# Altium schematic sheet pc_data_bus_input_switches.SchDoc
size A3; SheetNumber: 10; SheetTotal: 18
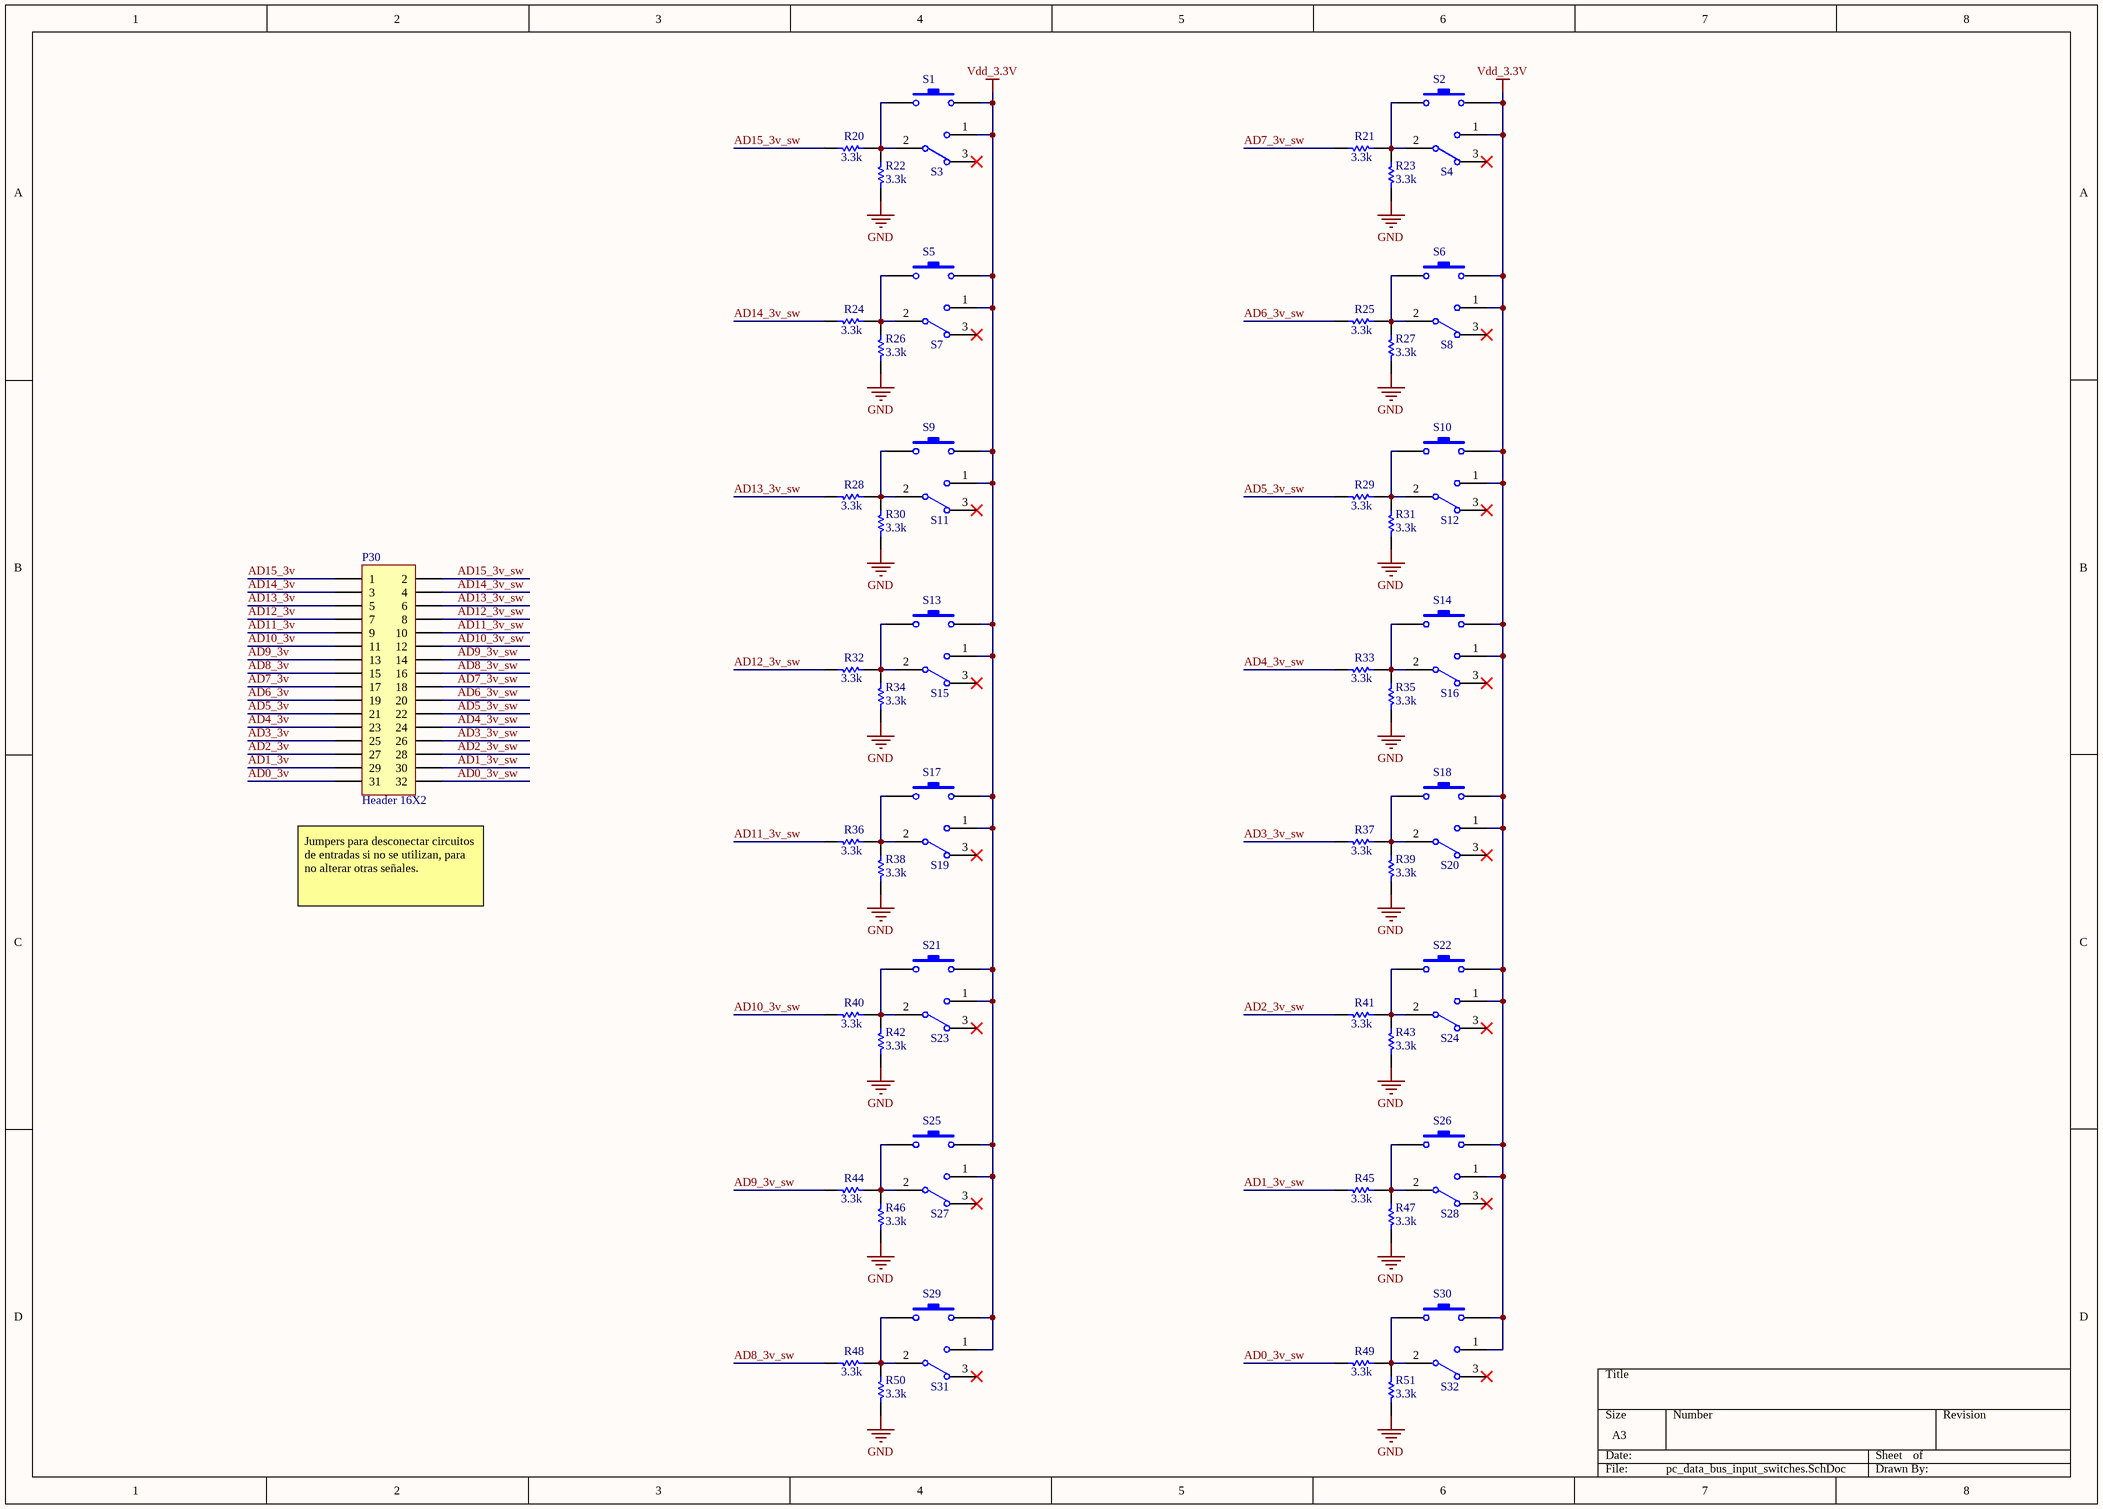
[diagram p0: pc_data_bus_input_switches.SchDoc]

## Parts
P30  Header 16X2  [HDR2X16]
R20  value 3.3k  [resistor 0603]  (hidden comment: resistor)
R21  value 3.3k  [resistor 0603]  (hidden comment: resistor)
R22  value 3.3k  [resistor 0603]  (hidden comment: resistor)
R23  value 3.3k  [resistor 0603]  (hidden comment: resistor)
R24  value 3.3k  [resistor 0603]  (hidden comment: resistor)
R25  value 3.3k  [resistor 0603]  (hidden comment: resistor)
R26  value 3.3k  [resistor 0603]  (hidden comment: resistor)
R27  value 3.3k  [resistor 0603]  (hidden comment: resistor)
R28  value 3.3k  [resistor 0603]  (hidden comment: resistor)
R29  value 3.3k  [resistor 0603]  (hidden comment: resistor)
R30  value 3.3k  [resistor 0603]  (hidden comment: resistor)
R31  value 3.3k  [resistor 0603]  (hidden comment: resistor)
R32  value 3.3k  [resistor 0603]  (hidden comment: resistor)
R33  value 3.3k  [resistor 0603]  (hidden comment: resistor)
R34  value 3.3k  [resistor 0603]  (hidden comment: resistor)
R35  value 3.3k  [resistor 0603]  (hidden comment: resistor)
R36  value 3.3k  [resistor 0603]  (hidden comment: resistor)
R37  value 3.3k  [resistor 0603]  (hidden comment: resistor)
R38  value 3.3k  [resistor 0603]  (hidden comment: resistor)
R39  value 3.3k  [resistor 0603]  (hidden comment: resistor)
R40  value 3.3k  [resistor 0603]  (hidden comment: resistor)
R41  value 3.3k  [resistor 0603]  (hidden comment: resistor)
R42  value 3.3k  [resistor 0603]  (hidden comment: resistor)
R43  value 3.3k  [resistor 0603]  (hidden comment: resistor)
R44  value 3.3k  [resistor 0603]  (hidden comment: resistor)
R45  value 3.3k  [resistor 0603]  (hidden comment: resistor)
R46  value 3.3k  [resistor 0603]  (hidden comment: resistor)
R47  value 3.3k  [resistor 0603]  (hidden comment: resistor)
R48  value 3.3k  [resistor 0603]  (hidden comment: resistor)
R49  value 3.3k  [resistor 0603]  (hidden comment: resistor)
R50  value 3.3k  [resistor 0603]  (hidden comment: resistor)
R51  value 3.3k  [resistor 0603]  (hidden comment: resistor)
S1  Button  [Tact switch]  (value not drawn)
S2  Button  [Tact switch]  (value not drawn)
S3  SW-SPDT  [Slide switch 2mm pitch]  (value not drawn)
S4  SW-SPDT  [Slide switch 2mm pitch]  (value not drawn)
S5  Button  [Tact switch]  (value not drawn)
S6  Button  [Tact switch]  (value not drawn)
S7  SW-SPDT  [Slide switch 2mm pitch]  (value not drawn)
S8  SW-SPDT  [Slide switch 2mm pitch]  (value not drawn)
S9  Button  [Tact switch]  (value not drawn)
S10  Button  [Tact switch]  (value not drawn)
S11  SW-SPDT  [Slide switch 2mm pitch]  (value not drawn)
S12  SW-SPDT  [Slide switch 2mm pitch]  (value not drawn)
S13  Button  [Tact switch]  (value not drawn)
S14  Button  [Tact switch]  (value not drawn)
S15  SW-SPDT  [Slide switch 2mm pitch]  (value not drawn)
S16  SW-SPDT  [Slide switch 2mm pitch]  (value not drawn)
S17  Button  [Tact switch]  (value not drawn)
S18  Button  [Tact switch]  (value not drawn)
S19  SW-SPDT  [Slide switch 2mm pitch]  (value not drawn)
S20  SW-SPDT  [Slide switch 2mm pitch]  (value not drawn)
S21  Button  [Tact switch]  (value not drawn)
S22  Button  [Tact switch]  (value not drawn)
S23  SW-SPDT  [Slide switch 2mm pitch]  (value not drawn)
S24  SW-SPDT  [Slide switch 2mm pitch]  (value not drawn)
S25  Button  [Tact switch]  (value not drawn)
S26  Button  [Tact switch]  (value not drawn)
S27  SW-SPDT  [Slide switch 2mm pitch]  (value not drawn)
S28  SW-SPDT  [Slide switch 2mm pitch]  (value not drawn)
S29  Button  [Tact switch]  (value not drawn)
S30  Button  [Tact switch]  (value not drawn)
S31  SW-SPDT  [Slide switch 2mm pitch]  (value not drawn)
S32  SW-SPDT  [Slide switch 2mm pitch]  (value not drawn)

## Nets
GND: R22.2 R23.2 R26.2 R27.2 R30.2 R31.2 R34.2 R35.2 R38.2 R39.2 R42.2 R43.2 R46.2 R47.2 R50.2 R51.2
Vdd_3.3V: S1.2 S2.2 S3.1 S4.1 S5.2 S6.2 S7.1 S8.1 S9.2 S10.2 S11.1 S12.1 S13.2 S14.2 S15.1 S16.1 S17.2 S18.2 S19.1 S20.1 S21.2 S22.2 S23.1 S24.1 S25.2 S26.2 S27.1 S28.1 S29.2 S30.2 S31.1 S32.1
AD0_3v: P30.31
AD0_3v_sw: P30.32 R49.1
AD1_3v: P30.29
AD1_3v_sw: P30.30 R45.1
AD2_3v: P30.27
AD2_3v_sw: P30.28 R41.1
AD3_3v: P30.25
AD3_3v_sw: P30.26 R37.1
AD4_3v: P30.23
AD4_3v_sw: P30.24 R33.1
AD5_3v: P30.21
AD5_3v_sw: P30.22 R29.1
AD6_3v: P30.19
AD6_3v_sw: P30.20 R25.1
AD7_3v: P30.17
AD7_3v_sw: P30.18 R21.1
AD8_3v: P30.15
AD8_3v_sw: P30.16 R48.1
AD9_3v: P30.13
AD9_3v_sw: P30.14 R44.1
AD10_3v: P30.11
AD10_3v_sw: P30.12 R40.1
AD11_3v: P30.9
AD11_3v_sw: P30.10 R36.1
AD12_3v: P30.7
AD12_3v_sw: P30.8 R32.1
AD13_3v: P30.5
AD13_3v_sw: P30.6 R28.1
AD14_3v: P30.3
AD14_3v_sw: P30.4 R24.1
AD15_3v: P30.1
AD15_3v_sw: P30.2 R20.1
NetR20_2: R20.2 R22.1 S1.1 S3.2
NetR21_2: R21.2 R23.1 S2.1 S4.2
NetR24_2: R24.2 R26.1 S5.1 S7.2
NetR25_2: R25.2 R27.1 S6.1 S8.2
NetR28_2: R28.2 R30.1 S9.1 S11.2
NetR29_2: R29.2 R31.1 S10.1 S12.2
NetR32_2: R32.2 R34.1 S13.1 S15.2
NetR33_2: R33.2 R35.1 S14.1 S16.2
NetR36_2: R36.2 R38.1 S17.1 S19.2
NetR37_2: R37.2 R39.1 S18.1 S20.2
NetR40_2: R40.2 R42.1 S21.1 S23.2
NetR41_2: R41.2 R43.1 S22.1 S24.2
NetR44_2: R44.2 R46.1 S25.1 S27.2
NetR45_2: R45.2 R47.1 S26.1 S28.2
NetR48_2: R48.2 R50.1 S29.1 S31.2
NetR49_2: R49.2 R51.1 S30.1 S32.2

Not connected (* = marked no-connect by the designer): S3 3*; S4 3*; S7 3*; S8 3*; S11 3*; S12 3*; S15 3*; S16 3*; S19 3*; S20 3*; S23 3*; S24 3*; S27 3*; S28 3*; S31 3*; S32 3*

## Notes on the sheet
- (near P30) Jumpers para desconectar circuitos de entradas si no se utilizan, para no alterar otras señales.

## Library data of the parts
P30 = Header 16X2: Header, 16-Pin, Dual row; LatestRevisionDate: 17-Jul-2002; LatestRevisionNote: Re-released for DXP Platform.; Publisher: Altium Limited
S1 S2 S5 S6 S9 S10 S13 S14 S17 S18 S21 S22 S25 S26 S29 S30 = SW-PB: Switch; pin to pad: 2>3
S3 S4 S7 S8 S11 S12 S15 S16 S19 S20 S23 S24 S27 S28 S31 S32 = SW-SPDT: SPDT Subminiature Toggle Switch, Right Angle Mounting, Vertical Actuation; Published: 24-Mar-1999; LatestRevisionDate: 17-Dec-2003; LatestRevisionNote: Schematic revised, PCB Footprint replaced.; DatasheetVersion: 05-Dec-2000; PackageReference: TL36WW15050; Publisher: Altium Limited; PackageDescription: Switch; 4 Leads; ComponentLink1Description: Manufacturer Link; ComponentLink1URL: http://www.apem.com
R20-R51 = resistor: Package: 0603